# Altium schematic sheet Button.SchDoc
size A4; SheetNumber: 1; SheetTotal: 1
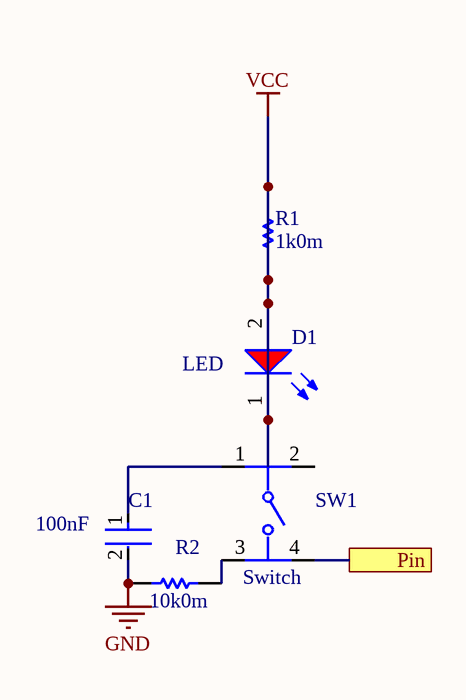
[diagram p0: Button.SchDoc]

## Parts
C1  100nF  [FP-C1206C-EB-MFG]
D1  LED  [WL-SMCW_0805_150080xx75000]
R1  1k0m  [RESC3216X60X45ML15T20]
R2  10k0m  [RESC3216X60X45ML10T20]
SW1  Switch  [FP-MJTP1212A-MFG]

## Ports
Pin

## Nets
GND: C1.2 R2.1
VCC: D1.1(K) D1.2(A) R1.1 R1.2
Pin: SW1.4 ; port Pin
NetC1_1: C1.1 SW1.1
NetR2_2: R2.2 SW1.3

Not connected (* = marked no-connect by the designer): SW1 2

## Library data of the parts
C1 = CMP-1037-04222-2: CAP CER 0.1UF 200V 10% X7R 1206; Manufacturer Part Number: C1206C104K2RACTU; Manufacturer: KEMET; Automotive Grade: Grade 0; Tolerance: 0.1; Value: 0.10 μF; Material: Ceramic; Temperature Coefficient: 15%; Description: C1206 0.10 μF X7R 10.00% 200 V; Automotive: Yes; Temperature Characteristic: X7R; Digikey Description: CAP CER 0.1UF 200V 10% X7R 1206; ComponentLink2URL: https://content.kemet.com/datasheets/KEM_C1007_X8R_ULTRA_150C_SMD.pdf; Voltage Rating: 200 V; Temperature Range High: +150°C; Device Class L1: Passive Components; Octopart: https://octopart.com/c1206c104k2ractu-kemet-9138344; Temperature: -55°C to +150°C; Height: 0.88mm; Device Class L3: Ceramic Capacitors; Lead Free: Yes; Package: C1206C-EB; Category: Cap; Temperature Range Low: -55°C; Mouser Description: Multilayer Ceramic Capacitors MLCC - SMD/SMT 200volts 0.1uF X7R 10%; Ipc Land Pattern Name: CAPC320160X78; Capacitance: 0.10 μF; RoHS: TRUE; ComponentLink2Description: Datasheet; Device Class L2: Capacitors
D1 = CMP-1426-00010-6: WL-SMCW SMD chip LED top view monocolor waterclear; Manufacturer Package Identifier: 0805 (2012 metric); Manufacturer Lifecycle Status: ACTIVE; Max Reverse Voltage (DC): 5V; Wavelength: 630nm; Lens Style: Clear, Rectangular; Luminous Intensity: 60mcd; Color: Red; YEOL: 1 = Estimated lifetime > 10 years; Power Dissipation: 72mW; Viewing Angle: 140°; Peak Wavelength: 645nm; Forward Current: 100mA; Test Current: 20mA; Max Junction Temperature (Tj): 95°C; Forward Voltage: 1.9V; Width: 1.25mm; Packaging: Tape and Reel; Max Operating Temperature: 85°C; Height: 700µm; Reverse Voltage: 5V; Length: 2mm; Dominant Wavelength: 630nm; Lifecycle Status: Production; Mount: Surface Mount; RoHS: Compliant; Case Code (Imperial): 0805; Case Code (Metric): 2012; REACH SVHC: Unknown; Min Operating Temperature: -40°C; Case/Package: 0805
R1 = CMP-2100-03616-1: Chip Resistor, 1 KOhm, +/- 1%, 0.25 W, -55 to 155 degC, 1206 (3216 Metric), RoHS, Tape and Reel; Manufacturer: Vishay Semiconductor; Power Rating: 250mW; Voltage Rating (DC): 200V; Resistance: 1KOhm; Temperature Coefficient: 100ppm/degreesC; Case Code (Imperial): 1206; Length: 3.2mm; Case/Package: 1206; Contact Plating: Tin; Package Quantity: 10; Datasheet URL: http://www.farnell.com/datasheets/1720486.pdf; Mount: SurfaceMount; Package Description: 2-Pin Surface Mount Device, Body 3.15 x 1.6 mm; Package Reference: 1206.0; Max Operating Temperature: 155degC; Lead Free: LeadFree; Weight: 0.000353oz; Military Standard: Not; Max Power Dissipation: 250mW; Case Code (Metric): 3216; Number of Terminations: 2; Tolerance: 1%; Width: 0.063inch; Termination: SMD/SMT; Number of Pins: 2; Min Operating Temperature: -55degC; Height: 0.55mm; Depth: 1.6mm; RoHSCompliant: true; Composition: ThickFilm; Packaging: TapeandReel; Manufacturer URL: http://www.vishay.com/; Voltage Rating: 200V; Radiation Hardening: No; REACH SVHC: Unknown; Datasheet Version: 41061.0
R2 = CMP-2003-04808-1: Manufacturer: Vishay Dale; Part Number: CRCW120610K0JNEA
SW1 = CMP-47024-000003-1: SWITCH TACTILE SPST-NO 0.05A 12V; Contact Resistance: 100mR; Operating Force: 160gf; Mechanical Life: 100000Cycles; Actuator Length: 3.5mm; Throw Configuration: SPST; Illumination Type: Non-Illuminated; Actuator Material: Polyoxymethylene; Actuator Type: Standard; Switch Travel: 0.3mm; Current Rating: 50mA; Switch Function: Off-Mom; Mount: Through Hole; Contact Plating: Silver; Max Voltage Rating (DC): 12V; Package Quantity: 100; Max Operating Temperature: 70°C; Packaging: Bulk; Voltage Rating (DC): 12V; Termination: PC Pin; Contact Material: Bronze; Orientation: Straight; Min Operating Temperature: -20°C; REACH SVHC: No SVHC; Electrical Life: 100000Cycles